# Altium schematic sheet Connect.SchDoc
size A4
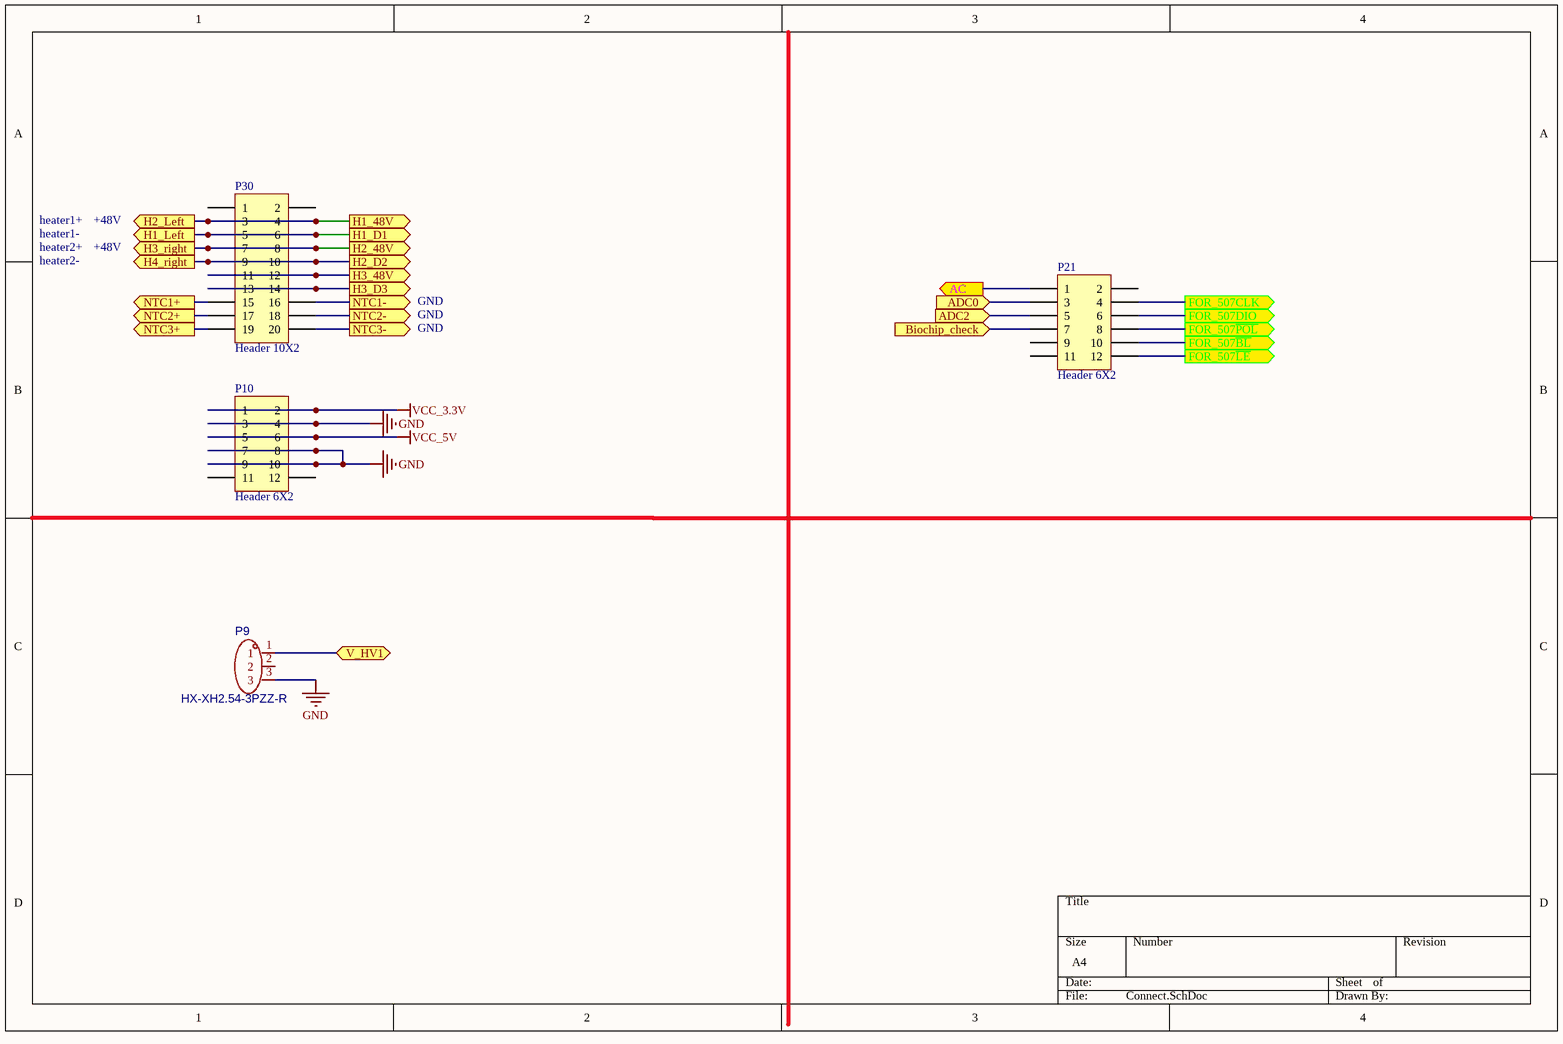
[diagram p0: Connect.SchDoc]

## Parts
P9  HX-XH2.54-3PZZ-R  [CONN-TH_3P-P2.50_HX-XH2.54-3PZZ-B]
P10  Header 6X2  [HDR-6X2]
P21  Header 6X2  [HDR-6X2]
P30  Header 10X2  [HDR-10X2]

## Ports
AC (out), ADC0 (in), ADC2 (in), Biochip_check (in), FOR_507CLK (out), FOR_507DIO (out), FOR_507~{BL} (out), FOR_507~{LE} (out), FOR_507~{POL} (out), H1_48V (out), H1_D1 (out), H1_Left (out), H2_48V (out), H2_D2 (out), H2_Left (out), H3_48V (out), H3_D3 (out), H3_right (out), H4_right (out), NTC1+ (out), NTC1- (out), NTC2+ (out), NTC2- (out), NTC3+ (out), NTC3- (out), V_HV1

## Nets
GND: P9.3 P10.3 P10.4 P10.7 P10.8 P10.9 P10.10
VCC_3.3V: P10.1 P10.2
VCC_5V: P10.5 P10.6
AC: P21.1 ; port AC
ADC0: P21.3 ; port ADC0
ADC2: P21.5 ; port ADC2
Biochip_check: P21.7 ; port Biochip_check
FOR_507~{BL}: P21.10 ; port FOR_507~{BL}
FOR_507CLK: P21.4 ; port FOR_507CLK
FOR_507DIO: P21.6 ; port FOR_507DIO
FOR_507~{LE}: P21.12 ; port FOR_507~{LE}
FOR_507~{POL}: P21.8 ; port FOR_507~{POL}
H1_48V: P30.3 P30.4 ; port H1_48V, port H2_Left
H1_D1: P30.5 P30.6 ; port H1_D1, port H1_Left
H2_48V: P30.7 P30.8 ; port H2_48V, port H3_right
H2_D2: P30.9 P30.10 ; port H2_D2, port H4_right
H3_48V: P30.11 P30.12 ; port H3_48V
H3_D3: P30.13 P30.14 ; port H3_D3
NTC1+: P30.15 ; port NTC1+
NTC1-: P30.16 ; port NTC1-
NTC2+: P30.17 ; port NTC2+
NTC2-: P30.18 ; port NTC2-
NTC3+: P30.19 ; port NTC3+
NTC3-: P30.20 ; port NTC3-
V_HV1: P9.1 ; port V_HV1

Not connected (* = marked no-connect by the designer): P9 2; P10 11 12; P21 2 9 11; P30 1 2

## Notes on the sheet
- heater1+
- heater1-
- heater2+
- +48V
- heater2-
- GND

## Library data of the parts
P9 = HX-XH2.54-3PZZ-R: AddInBom: yes; Pins Structure: 1x3P; Pitch: 2.54mm; Reference Series: XH; Number of PINs Per Row: 3; Current Rating: 3A; Voltage Rating: 250V; Plastic Material: PA66; Flame Retardant Rating: UL94V-0; Symbol: HX-XH2.54-3PZZ-R; Device: HX-XH2.54-3PZZ-R; SupplierPart: C49010011; ManufacturerPart: HX-XH2.54-3PZZ-R; JLCPCB Part Class: Extended Part; Datasheet: https://item.szlcsc.com/datasheet/HX-XH2.54-3PZZ-R/51365932.html; Supplier: LCSC; ConvertToPcb: yes; FootprintName: CONN-TH_3P-P2.50_HX-XH2.54-3PZZ-B; Number of Pins: 3P; Number of Rows: 1; Row Spacing: -; Supplementary Features: -; Z-Height of the Board: -; X-Length of Bottom Edge on Board (Spacing Line): -; Y-Width of Bottom Edge on Board: -
P10 P21 = Header 6X2: Header, 6-Pin, Dual row; LatestRevisionDate: 17-Jul-2002; LatestRevisionNote: Re-released for DXP Platform.; Publisher: Altium Limited
P30 = Header 10X2: Header, 10-Pin, Dual row; LatestRevisionDate: 17-Jul-2002; LatestRevisionNote: Re-released for DXP Platform.; Publisher: Altium Limited